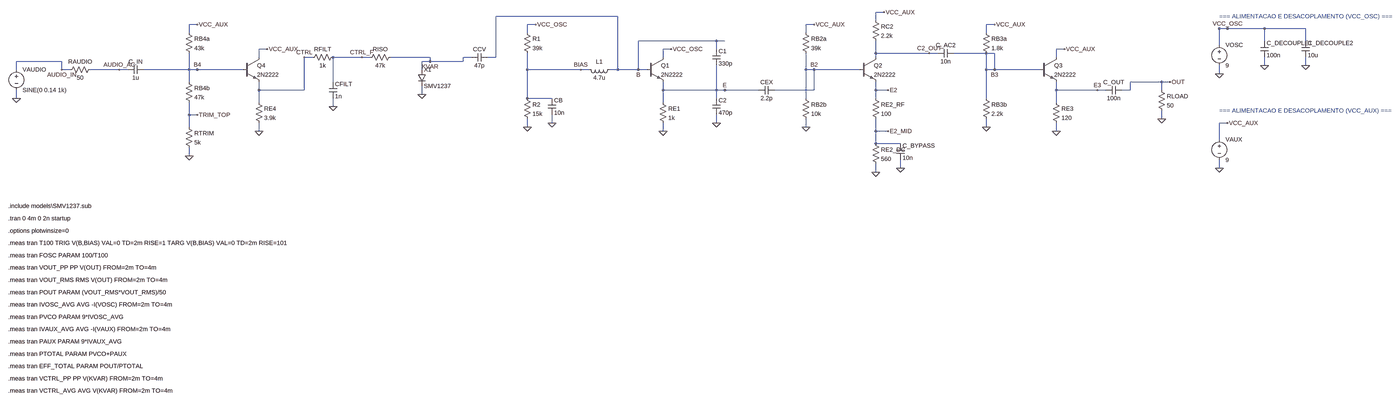
[diagram p0: schematic S6_modulacao_fm_completa.asc, whole sheet]
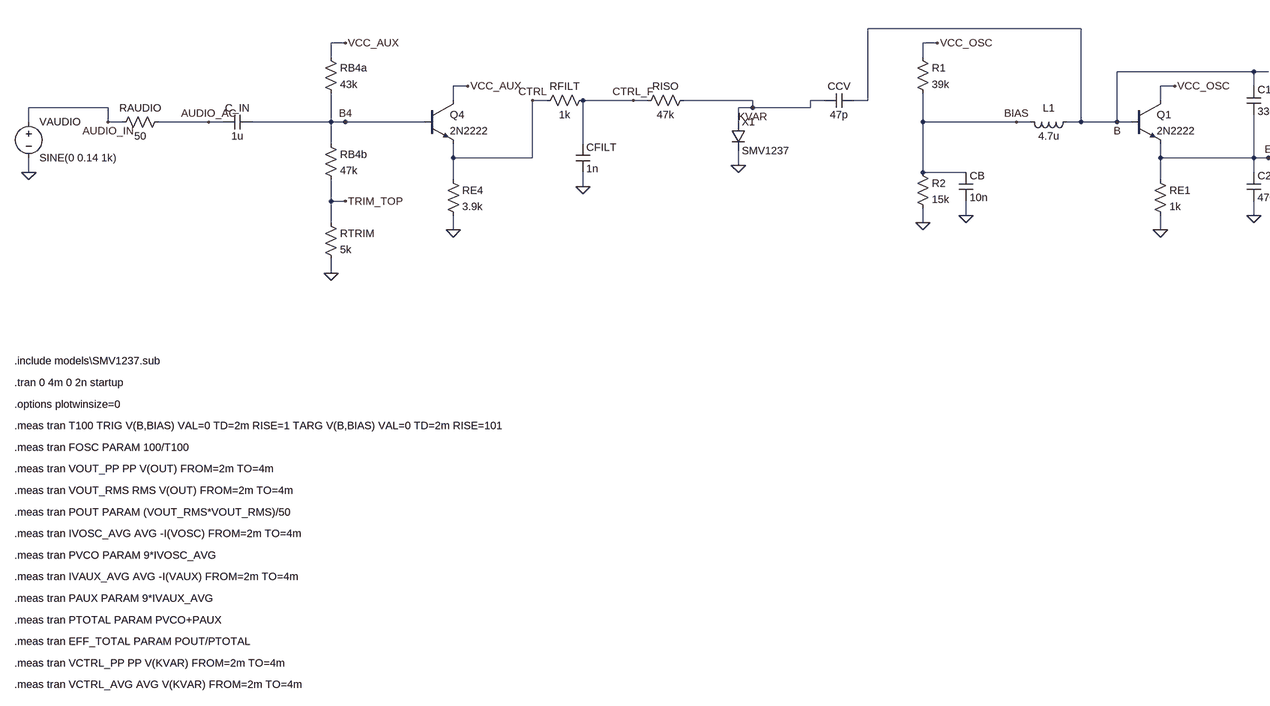
[diagram p1: schematic S6_modulacao_fm_completa.asc, part, row 1 of 1, column 1 of 2]
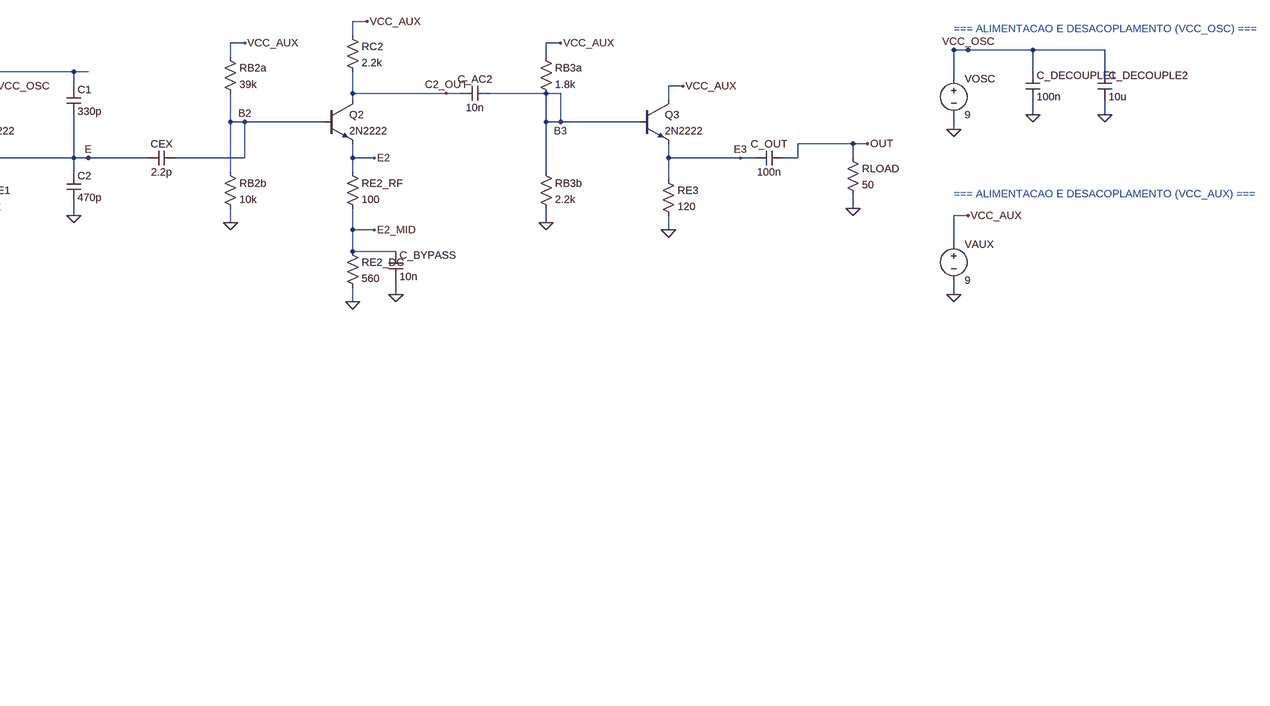
[diagram p2: schematic S6_modulacao_fm_completa.asc, part, row 1 of 1, column 2 of 2]
S6_modulacao_fm_completa.asc, the LTspice schematic file:
Version 4
SHEET 1 7200 1712
WIRE 96 368 96 400
WIRE 304 288 272 288
WIRE 384 288 416 288
WIRE 528 288 496 288
WIRE 592 288 624 288
WIRE 768 144 768 112
WIRE 768 112 800 112
WIRE 768 224 768 336
WIRE 768 288 800 288
WIRE 768 416 768 512
WIRE 768 464 800 464
WIRE 768 592 768 624
WIRE 976 288 944 288
WIRE 1040 240 1040 208
WIRE 1040 208 1072 208
WIRE 1040 336 1040 416
WIRE 1040 368 1088 368
WIRE 1040 496 1040 528
WIRE 1248 240 1216 240
WIRE 1328 240 1328 336
WIRE 1328 240 1360 240
WIRE 1328 400 1328 432
WIRE 1472 240 1440 240
WIRE 1552 240 1584 240
WIRE 1712 288 1712 256
WIRE 1712 256 1744 256
WIRE 1712 352 1712 384
WIRE 1904 240 1872 240
WIRE 1968 240 2000 240
WIRE 2144 144 2144 112
WIRE 2144 112 2176 112
WIRE 2144 224 2144 400
WIRE 2144 288 2176 288
WIRE 2144 480 2144 512
WIRE 2144 400 2240 400
WIRE 2240 464 2240 496
WIRE 2384 288 2352 288
WIRE 2464 288 2496 288
WIRE 2608 288 2576 288
WIRE 2672 240 2672 208
WIRE 2672 208 2704 208
WIRE 2672 336 2672 416
WIRE 2672 368 2720 368
WIRE 2672 496 2672 528
WIRE 2880 208 2880 176
WIRE 2880 176 2912 176
WIRE 2880 272 2880 400
WIRE 2880 368 2912 368
WIRE 2880 464 2880 496
WIRE 3088 368 3056 368
WIRE 3152 368 3184 368
WIRE 3328 144 3328 112
WIRE 3328 112 3360 112
WIRE 3328 224 3328 400
WIRE 3328 288 3360 288
WIRE 3328 480 3328 512
WIRE 3536 288 3504 288
WIRE 3600 96 3600 64
WIRE 3600 64 3632 64
WIRE 3600 176 3600 240
WIRE 3600 224 3648 224
WIRE 3600 336 3600 400
WIRE 3600 368 3648 368
WIRE 3600 480 3600 576
WIRE 3600 528 3648 528
WIRE 3600 656 3600 688
WIRE 3600 576 3696 576
WIRE 3696 640 3696 672
WIRE 3840 224 3808 224
WIRE 3904 224 3936 224
WIRE 4080 144 4080 112
WIRE 4080 112 4112 112
WIRE 4080 224 4080 400
WIRE 4080 288 4112 288
WIRE 4080 480 4080 512
WIRE 4288 288 4256 288
WIRE 4352 240 4352 208
WIRE 4352 208 4384 208
WIRE 4352 336 4352 416
WIRE 4352 368 4400 368
WIRE 4352 496 4352 528
WIRE 4544 368 4512 368
WIRE 4608 368 4640 368
WIRE 4784 368 4784 336
WIRE 4784 336 4816 336
WIRE 4784 448 4784 480
WIRE 5008 192 5008 128
WIRE 5008 272 5008 304
WIRE 5184 176 5184 128
WIRE 5184 240 5184 272
WIRE 5344 176 5344 128
WIRE 5344 240 5344 272
WIRE 5008 128 5344 128
WIRE 5008 128 5040 128
WIRE 5008 560 5008 496
WIRE 5008 640 5008 672
WIRE 5008 496 5040 496
WIRE 96 288 96 256
WIRE 96 256 128 256
WIRE 416 288 496 288
WIRE 1360 240 1440 240
WIRE 4400 368 4512 368
WIRE 3648 224 3808 224
WIRE 128 256 272 256
WIRE 272 256 272 288
WIRE 2176 288 2352 288
WIRE 4640 368 4640 336
WIRE 4640 336 4816 336
WIRE 1088 368 1216 368
WIRE 1216 368 1216 240
WIRE 1584 240 1744 240
WIRE 1744 240 1744 256
WIRE 1744 256 1872 256
WIRE 1872 256 1872 240
WIRE 624 288 800 288
WIRE 800 288 944 288
WIRE 2720 368 2912 368
WIRE 2912 368 3056 368
WIRE 3936 224 4112 224
WIRE 4112 224 4112 288
WIRE 4112 288 4256 288
WIRE 3184 368 3360 368
WIRE 3360 368 3360 288
WIRE 3360 288 3504 288
WIRE 2000 240 2000 80
WIRE 2000 80 2496 80
WIRE 2496 80 2496 288
WIRE 2496 288 2576 288
WIRE 2576 288 2576 176
WIRE 2576 176 2912 176
FLAG 96 400 0
FLAG 272 288 AUDIO_IN
FLAG 496 288 AUDIO_AC
FLAG 800 112 VCC_AUX
FLAG 800 288 B4
FLAG 800 464 TRIM_TOP
FLAG 768 624 0
FLAG 1072 208 VCC_AUX
FLAG 1040 528 0
FLAG 1216 240 CTRL
FLAG 1328 432 0
FLAG 1440 240 CTRL_F
FLAG 1744 256 KVAR
FLAG 1712 384 0
FLAG 2176 112 VCC_OSC
FLAG 2144 512 0
FLAG 2240 496 0
FLAG 2352 288 BIAS
FLAG 2576 288 B
FLAG 2704 208 VCC_OSC
FLAG 2672 528 0
FLAG 2912 368 E
FLAG 2880 496 0
FLAG 3360 112 VCC_AUX
FLAG 3360 288 B2
FLAG 3328 512 0
FLAG 3632 64 VCC_AUX
FLAG 3648 368 E2
FLAG 3648 528 E2_MID
FLAG 3600 688 0
FLAG 3696 672 0
FLAG 3808 224 C2_OUT
FLAG 4112 112 VCC_AUX
FLAG 4112 288 B3
FLAG 4080 512 0
FLAG 4384 208 VCC_AUX
FLAG 4352 528 0
FLAG 4512 368 E3
FLAG 4816 336 OUT
FLAG 4784 480 0
FLAG 5008 304 0
FLAG 5184 272 0
FLAG 5344 272 0
FLAG 5040 128 VCC_OSC
FLAG 5008 672 0
FLAG 5040 496 VCC_AUX
SYMBOL voltage 96 272 R0
WINDOW 3 24 96 Left 2
SYMATTR InstName VAUDIO
SYMATTR Value SINE(0 0.14 1k)
SYMBOL res 400 272 R90
WINDOW 0 0 56 VBottom 2
WINDOW 3 32 56 VTop 2
SYMATTR InstName RAUDIO
SYMATTR Value 50
SYMBOL cap 592 272 R90
WINDOW 0 0 32 VBottom 2
WINDOW 3 32 32 VTop 2
SYMATTR InstName C_IN
SYMATTR Value 1u
SYMBOL res 752 128 R0
SYMATTR InstName RB4a
SYMATTR Value 43k
SYMBOL res 752 320 R0
SYMATTR InstName RB4b
SYMATTR Value 47k
SYMBOL res 752 496 R0
SYMATTR InstName RTRIM
SYMATTR Value 5k
SYMBOL npn 976 240 R0
SYMATTR InstName Q4
SYMATTR Value 2N2222
SYMBOL res 1024 400 R0
SYMATTR InstName RE4
SYMATTR Value 3.9k
SYMBOL res 1344 224 R90
WINDOW 0 0 56 VBottom 2
WINDOW 3 32 56 VTop 2
SYMATTR InstName RFILT
SYMATTR Value 1k
SYMBOL cap 1312 336 R0
SYMATTR InstName CFILT
SYMATTR Value 1n
SYMBOL res 1568 224 R90
WINDOW 0 0 56 VBottom 2
WINDOW 3 32 56 VTop 2
SYMATTR InstName RISO
SYMATTR Value 47k
SYMBOL diode 1696 288 R0
SYMATTR InstName X1
SYMATTR Value SMV1237
SYMATTR Prefix X
SYMBOL cap 1968 224 R90
WINDOW 0 0 32 VBottom 2
WINDOW 3 32 32 VTop 2
SYMATTR InstName CCV
SYMATTR Value 47p
SYMBOL res 2128 128 R0
SYMATTR InstName R1
SYMATTR Value 39k
SYMBOL res 2128 384 R0
SYMATTR InstName R2
SYMATTR Value 15k
SYMBOL cap 2224 400 R0
SYMATTR InstName CB
SYMATTR Value 10n
SYMBOL ind 2480 272 R90
WINDOW 0 0 56 VBottom 2
WINDOW 3 32 56 VTop 2
SYMATTR InstName L1
SYMATTR Value 4.7u
SYMATTR SpiceLine Rser=5.4
SYMBOL npn 2608 240 R0
SYMATTR InstName Q1
SYMATTR Value 2N2222
SYMBOL res 2656 400 R0
SYMATTR InstName RE1
SYMATTR Value 1k
SYMBOL cap 2864 208 R0
SYMATTR InstName C1
SYMATTR Value 330p
SYMBOL cap 2864 400 R0
SYMATTR InstName C2
SYMATTR Value 470p
SYMBOL cap 3152 352 R90
WINDOW 0 0 32 VBottom 2
WINDOW 3 32 32 VTop 2
SYMATTR InstName CEX
SYMATTR Value 2.2p
SYMBOL res 3312 128 R0
SYMATTR InstName RB2a
SYMATTR Value 39k
SYMBOL res 3312 384 R0
SYMATTR InstName RB2b
SYMATTR Value 10k
SYMBOL npn 3536 240 R0
SYMATTR InstName Q2
SYMATTR Value 2N2222
SYMBOL res 3584 80 R0
SYMATTR InstName RC2
SYMATTR Value 2.2k
SYMBOL res 3584 384 R0
SYMATTR InstName RE2_RF
SYMATTR Value 100
SYMBOL res 3584 560 R0
SYMATTR InstName RE2_DC
SYMATTR Value 560
SYMBOL cap 3680 576 R0
SYMATTR InstName C_BYPASS
SYMATTR Value 10n
SYMBOL cap 3904 208 R90
WINDOW 0 0 32 VBottom 2
WINDOW 3 32 32 VTop 2
SYMATTR InstName C_AC2
SYMATTR Value 10n
SYMBOL res 4064 128 R0
SYMATTR InstName RB3a
SYMATTR Value 1.8k
SYMBOL res 4064 384 R0
SYMATTR InstName RB3b
SYMATTR Value 2.2k
SYMBOL npn 4288 240 R0
SYMATTR InstName Q3
SYMATTR Value 2N2222
SYMBOL res 4336 400 R0
SYMATTR InstName RE3
SYMATTR Value 120
SYMBOL cap 4608 352 R90
WINDOW 0 0 32 VBottom 2
WINDOW 3 32 32 VTop 2
SYMATTR InstName C_OUT
SYMATTR Value 100n
SYMBOL res 4768 352 R0
SYMATTR InstName RLOAD
SYMATTR Value 50
SYMBOL voltage 5008 176 R0
WINDOW 3 24 96 Left 2
SYMATTR InstName VOSC
SYMATTR Value 9
SYMBOL cap 5168 176 R0
SYMATTR InstName C_DECOUPLE1
SYMATTR Value 100n
SYMBOL cap 5328 176 R0
SYMATTR InstName C_DECOUPLE2
SYMATTR Value 10u
SYMBOL voltage 5008 544 R0
WINDOW 3 24 96 Left 2
SYMATTR InstName VAUX
SYMATTR Value 9
TEXT 5008 80 Left 2 ;=== ALIMENTACAO E DESACOPLAMENTO (VCC_OSC) ===
TEXT 5008 448 Left 2 ;=== ALIMENTACAO E DESACOPLAMENTO (VCC_AUX) ===
TEXT 64 848 Left 2 !.include models\SMV1237.sub
TEXT 64 896 Left 2 !.tran 0 4m 0 2n startup
TEXT 64 944 Left 2 !.options plotwinsize=0
TEXT 64 992 Left 2 !.meas tran T100 TRIG V(B,BIAS) VAL=0 TD=2m RISE=1 TARG V(B,BIAS) VAL=0 TD=2m RISE=101
TEXT 64 1040 Left 2 !.meas tran FOSC PARAM 100/T100
TEXT 64 1088 Left 2 !.meas tran VOUT_PP PP V(OUT) FROM=2m TO=4m
TEXT 64 1136 Left 2 !.meas tran VOUT_RMS RMS V(OUT) FROM=2m TO=4m
TEXT 64 1184 Left 2 !.meas tran POUT PARAM (VOUT_RMS*VOUT_RMS)/50
TEXT 64 1232 Left 2 !.meas tran IVOSC_AVG AVG -I(VOSC) FROM=2m TO=4m
TEXT 64 1280 Left 2 !.meas tran PVCO PARAM 9*IVOSC_AVG
TEXT 64 1328 Left 2 !.meas tran IVAUX_AVG AVG -I(VAUX) FROM=2m TO=4m
TEXT 64 1376 Left 2 !.meas tran PAUX PARAM 9*IVAUX_AVG
TEXT 64 1424 Left 2 !.meas tran PTOTAL PARAM PVCO+PAUX
TEXT 64 1472 Left 2 !.meas tran EFF_TOTAL PARAM POUT/PTOTAL
TEXT 64 1520 Left 2 !.meas tran VCTRL_PP PP V(KVAR) FROM=2m TO=4m
TEXT 64 1568 Left 2 !.meas tran VCTRL_AVG AVG V(KVAR) FROM=2m TO=4m

The netlist it stands for:
* S6_modulacao_fm_completa.asc
VAUDIO AUDIO_IN 0 SINE(0 0.14 1k)
RAUDIO AUDIO_AC AUDIO_IN 50
C_IN B4 AUDIO_AC 1u
RB4a VCC_AUX B4 43k
RB4b B4 TRIM_TOP 47k
RTRIM TRIM_TOP 0 5k
Q4 VCC_AUX B4 CTRL 0 2N2222
RE4 CTRL 0 3.9k
RFILT CTRL_F CTRL 1k
CFILT CTRL_F 0 1n
RISO KVAR CTRL_F 47k
XX1 KVAR 0 SMV1237  ; pins + -
CCV B KVAR 47p
R1 VCC_OSC BIAS 39k
R2 BIAS 0 15k
CB BIAS 0 10n
L1 B BIAS 4.7u Rser=5.4
Q1 VCC_OSC B E 0 2N2222
RE1 E 0 1k
C1 B E 330p
C2 E 0 470p
CEX B2 E 2.2p
RB2a VCC_AUX B2 39k
RB2b B2 0 10k
Q2 C2_OUT B2 E2 0 2N2222
RC2 VCC_AUX C2_OUT 2.2k
RE2_RF E2 E2_MID 100
RE2_DC E2_MID 0 560
C_BYPASS E2_MID 0 10n
C_AC2 B3 C2_OUT 10n
RB3a VCC_AUX B3 1.8k
RB3b B3 0 2.2k
Q3 VCC_AUX B3 E3 0 2N2222
RE3 E3 0 120
C_OUT OUT E3 100n
RLOAD OUT 0 50
VOSC VCC_OSC 0 9
C_DECOUPLE1 VCC_OSC 0 100n
C_DECOUPLE2 VCC_OSC 0 10u
VAUX VCC_AUX 0 9
.model NPN NPN
.model PNP PNP
.lib standard.bjt
* === ALIMENTACAO E DESACOPLAMENTO (VCC_OSC) ===
* === ALIMENTACAO E DESACOPLAMENTO (VCC_AUX) ===
.include models\SMV1237.sub
.tran 0 4m 0 2n startup
.options plotwinsize=0
.meas tran T100 TRIG V(B,BIAS) VAL=0 TD=2m RISE=1 TARG V(B,BIAS) VAL=0 TD=2m RISE=101
.meas tran FOSC PARAM 100/T100
.meas tran VOUT_PP PP V(OUT) FROM=2m TO=4m
.meas tran VOUT_RMS RMS V(OUT) FROM=2m TO=4m
.meas tran POUT PARAM (VOUT_RMS*VOUT_RMS)/50
.meas tran IVOSC_AVG AVG -I(VOSC) FROM=2m TO=4m
.meas tran PVCO PARAM 9*IVOSC_AVG
.meas tran IVAUX_AVG AVG -I(VAUX) FROM=2m TO=4m
.meas tran PAUX PARAM 9*IVAUX_AVG
.meas tran PTOTAL PARAM PVCO+PAUX
.meas tran EFF_TOTAL PARAM POUT/PTOTAL
.meas tran VCTRL_PP PP V(KVAR) FROM=2m TO=4m
.meas tran VCTRL_AVG AVG V(KVAR) FROM=2m TO=4m
.backanno
.end